# EAGLE schematic LDC_Schematic (1) (EAGLE 8.2.2)
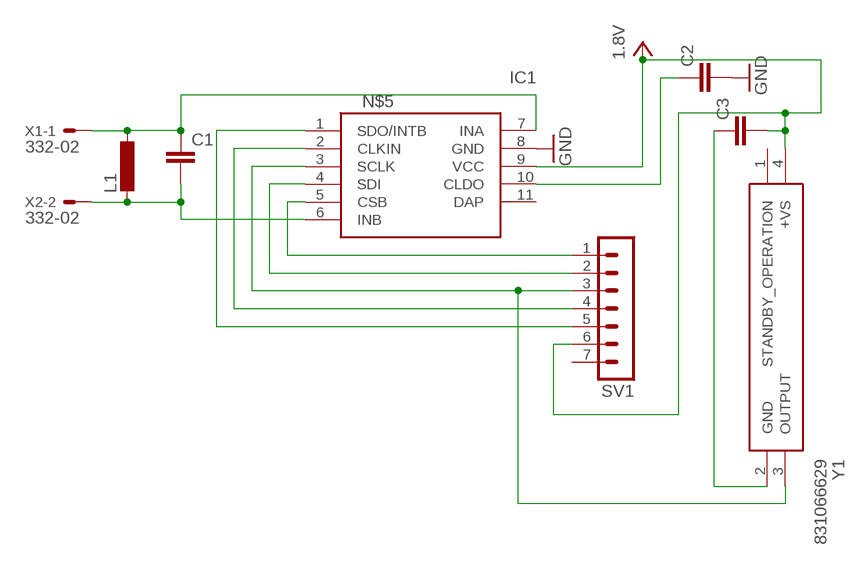
[diagram p0: schematic, sheet 1]

## Parts
C1  C-EUC0805  [C0805]
C2  C-EUC0805  [C0805]
C3  C-EUC0805  [C0805]
IC1  LDC1101DRCR  [TPS74901DRCR]
L1  L-EUL8530M  [L8530M]
SV1  MA07-1  [MA07-1]
X1  332-02  [332-02]
X2  332-02  [332-02]
Y1  831066629  [831066629]

## Nets
GND: C2.2 IC1.8(GND)
N$1: C1.2 IC1.6(INB) L1.2 X2.2
N$2: C1.1 IC1.7(INA) L1.1 X1.1
N$3: C3.1 Y1.2(GND)
N$4: C2.1 IC1.10(CLDO)
N$5: IC1.1(SDO/INTB) SV1.5
N$6: IC1.2(CLKIN) SV1.4
N$8: IC1.4(SDI) SV1.2
N$9: IC1.5(CSB) SV1.1
N$10: IC1.3(SCLK) SV1.3 Y1.3(OUTPUT)
VCC: C3.2 IC1.9(VCC) SV1.6 Y1.4(+VS) ; supply symbol labelled 1.8V
Unconnected: IC1.11(DAP) SV1.7 X1.2 X2.1 Y1.1(STANDBY_OPERATION)

## Library data of the parts
C1-C3 = rcl:C-EU: CAPACITOR, European symbol; SPICEPREFIX: C
IC1 = LDC1101DRCR:LDC1101DRCR: 1.8V, High Resolution Inductance to Digital Converter Source: Datasheet <http://www.ti.com/lit/gpn/ldc1101>; DESCRIPTION: 1.8V, High Resolution Inductance to Digital Converter; HEIGHT: mm; MANUFACTURER_NAME: Texas Instruments; MANUFACTURER_PART_NUMBER: LDC1101DRCR; MOUSER_PART_NUMBER: 595-LDC1101DRCR; MOUSER_PRICE-STOCK: https://www.mouser.co.uk/ProductDetail/Texas-Instruments/LDC1101DRCR?qs=GJ%2F2ZGcr5uOdE4MCIXn97A%3D%3D
L1 = rcl:L-EU: INDUCTOR, European symbol; SPICEPREFIX: L
SV1 = con-lstb:MA07-1: PIN HEADER; OC_FARNELL: unknown; OC_NEWARK: unknown
X1 X2 = con-garry:332-02: 2 Pin - 2mm Dual Row Source: www.mpe-connector.de / garry_shortform_2012.pdf
Y1 = 831066629:831066629: Standard Clock Oscillators WE-SPXO 16.0MHz 50ppm 2.0 x 1.6mm Source: Datasheet <https://www.we-online.com/catalog/datasheet/831066629.pdf>; DESCRIPTION: Standard Clock Oscillators WE-SPXO 16.0MHz 50ppm 2.0 x 1.6mm; HEIGHT: 0.8mm; MANUFACTURER_NAME: Wurth Elektronik; MANUFACTURER_PART_NUMBER: 831066629; MOUSER_PART_NUMBER: 710-831066629; MOUSER_PRICE-STOCK: https://www.mouser.co.uk/ProductDetail/Wurth-Elektronik/831066629?qs=2WXlatMagcHA0ETpyr13Zw%3D%3D